# Altium schematic sheet MCU.SchDoc
size A4; SheetNumber: 2; SheetTotal: 8
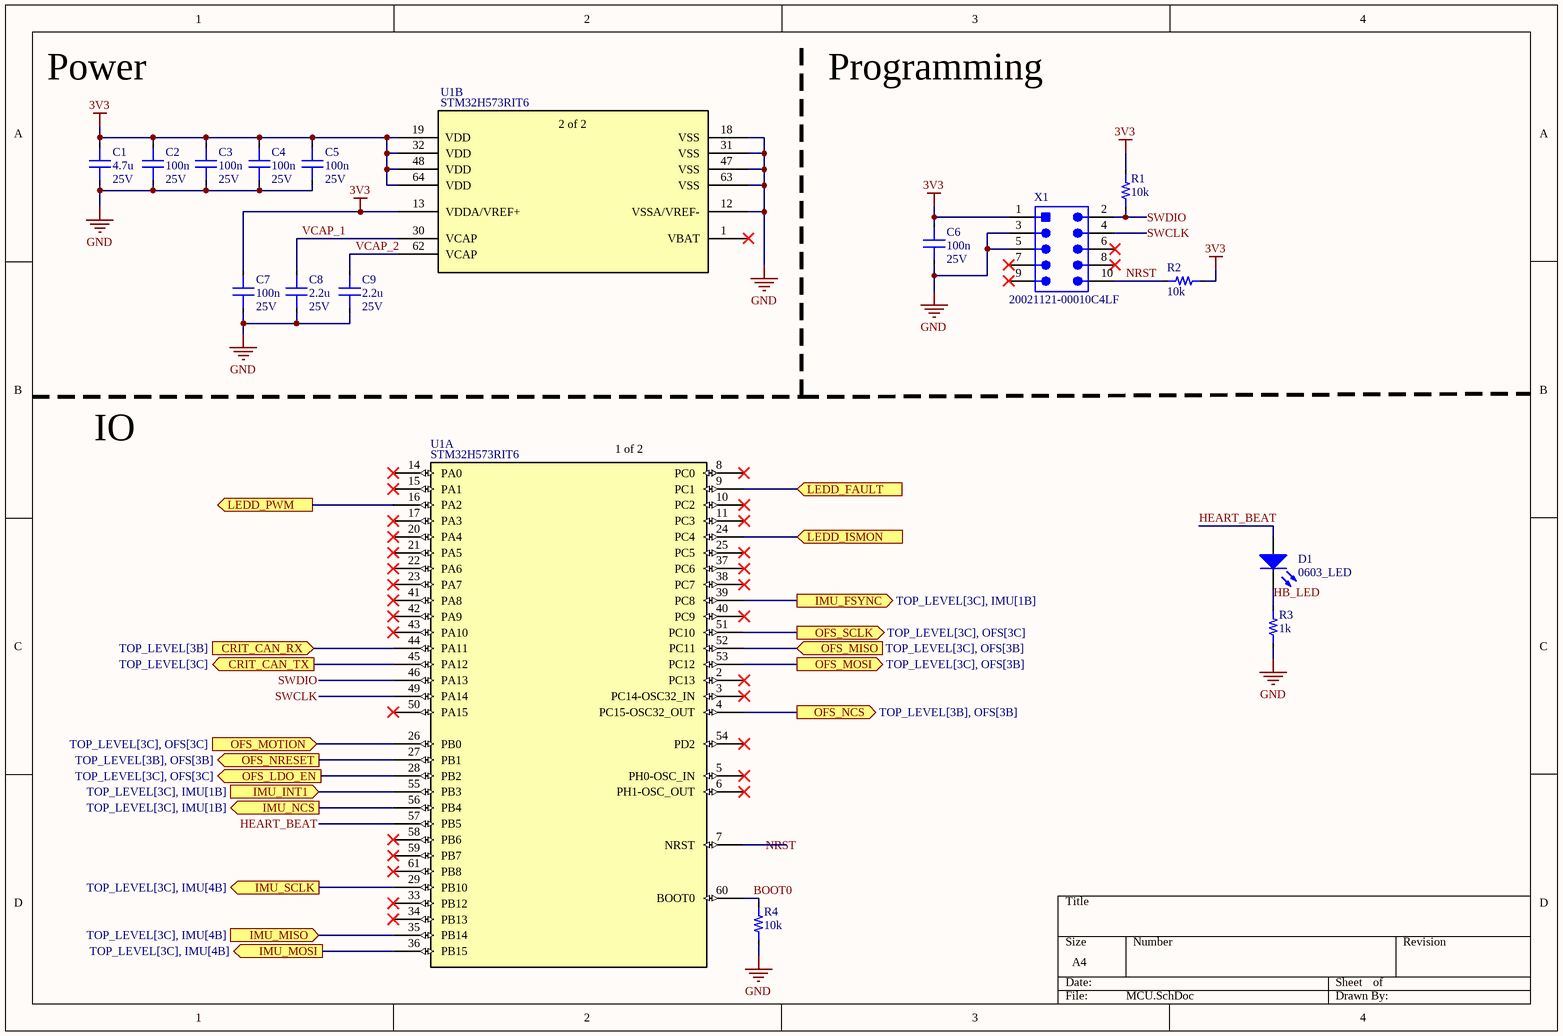
[diagram p0: MCU.SchDoc]

## Parts
C1  value 4.7u  Voltage: 25V  [0603_CAP]  (hidden comment: Capacitor)
C2  value 100n  Voltage: 25V  [0603_CAP]  (hidden comment: Capacitor)
C3  value 100n  Voltage: 25V  [0603_CAP]  (hidden comment: Capacitor)
C4  value 100n  Voltage: 25V  [0603_CAP]  (hidden comment: Capacitor)
C5  value 100n  Voltage: 25V  [0603_CAP]  (hidden comment: Capacitor)
C6  value 100n  Voltage: 25V  [0603_CAP]  (hidden comment: Capacitor)
C7  value 100n  Voltage: 25V  [0603_CAP]  (hidden comment: Capacitor)
C8  value 2.2u  Voltage: 25V  [0603_CAP]  (hidden comment: Capacitor)
C9  value 2.2u  Voltage: 25V  [0603_CAP]  (hidden comment: Capacitor)
D1  0603_LED  [0603_LED]
R1  value 10k  [0603_RES]  (hidden comment: Resistor)
R2  value 10k  [0603_RES]  (hidden comment: Resistor)
R3  value 1k  [0603_RES]  (hidden comment: Resistor)
R4  value 10k  [0603_RES]  (hidden comment: Resistor)
U1  STM32H573RIT6  [LQFP64-10x10mm_STM]  (parts A,B of 2)
X1  20021121-00010C4LF  [HDR2X5_SMT]

## Ports
CRIT_CAN_RX (in, see TOP_LEVEL[3B]), CRIT_CAN_TX (out, see TOP_LEVEL[3C]), IMU_FSYNC (out, see TOP_LEVEL[3C], IMU[1B]), IMU_INT1 (in, see TOP_LEVEL[3C], IMU[1B]), IMU_MISO (in, see TOP_LEVEL[3C], IMU[4B]), IMU_MOSI (out, see TOP_LEVEL[3C], IMU[4B]), IMU_NCS (out, see TOP_LEVEL[3C], IMU[1B]), IMU_SCLK (out, see TOP_LEVEL[3C], IMU[4B]), LEDD_FAULT (in), LEDD_ISMON (in), LEDD_PWM (out), OFS_LDO_EN (out, see TOP_LEVEL[3C], OFS[3C]), OFS_MISO (in, see TOP_LEVEL[3C], OFS[3B]), OFS_MOSI (out, see TOP_LEVEL[3C], OFS[3B]), OFS_MOTION (in, see TOP_LEVEL[3C], OFS[3C]), OFS_NCS (out, see TOP_LEVEL[3B], OFS[3B]), OFS_NRESET (out, see TOP_LEVEL[3B], OFS[3B]), OFS_SCLK (out, see TOP_LEVEL[3C], OFS[3C])

## Nets
3V3: C1.1 C2.1 C3.1 C4.1 C5.1 C6.1 C7.1 R1.1 R2.2 U1.13(VDDA/VREF+) U1.19(VDD) U1.32(VDD) U1.48(VDD) U1.64(VDD) X1.1
GND: C1.2 C2.2 C3.2 C4.2 C5.2 C6.2 C7.2 C8.2 C9.2 R3.1 R4.1 U1.12(VSSA/VREF-) U1.18(VSS) U1.31(VSS) U1.47(VSS) U1.63(VSS) X1.3 X1.5
BOOT0: R4.2 U1.60(BOOT0)
CRIT_CAN_RX: U1.44(PA11) ; port CRIT_CAN_RX
CRIT_CAN_TX: U1.45(PA12) ; port CRIT_CAN_TX
HB_LED: D1.1(C) R3.2
HEART_BEAT: D1.2(A) U1.57(PB5)
IMU_FSYNC: U1.39(PC8) ; port IMU_FSYNC
IMU_INT1: U1.55(PB3) ; port IMU_INT1
IMU_MISO: U1.35(PB14) ; port IMU_MISO
IMU_MOSI: U1.36(PB15) ; port IMU_MOSI
IMU_NCS: U1.56(PB4) ; port IMU_NCS
IMU_SCLK: U1.29(PB10) ; port IMU_SCLK
LEDD_FAULT: U1.9(PC1) ; port LEDD_FAULT
LEDD_ISMON: U1.24(PC4) ; port LEDD_ISMON
LEDD_PWM: U1.16(PA2) ; port LEDD_PWM
NRST: R2.1 U1.7(NRST) X1.10
OFS_LDO_EN: U1.28(PB2) ; port OFS_LDO_EN
OFS_MISO: U1.52(PC11) ; port OFS_MISO
OFS_MOSI: U1.53(PC12) ; port OFS_MOSI
OFS_MOTION: U1.26(PB0) ; port OFS_MOTION
OFS_NCS: U1.4(PC15-OSC32_OUT) ; port OFS_NCS
OFS_NRESET: U1.27(PB1) ; port OFS_NRESET
OFS_SCLK: U1.51(PC10) ; port OFS_SCLK
SWCLK: U1.49(PA14) X1.4
SWDIO: R1.2 U1.46(PA13) X1.2
VCAP_1: C8.1 U1.30(VCAP)
VCAP_2: C9.1 U1.62(VCAP)

Not connected (* = marked no-connect by the designer): U1 1(VBAT)* 2(PC13)* 3(PC14-OSC32_IN)* 5(PH0-OSC_IN)* 6(PH1-OSC_OUT)* 8(PC0)* 10(PC2)* 11(PC3)* 14(PA0)* 15(PA1)* 17(PA3)* 20(PA4)* 21(PA5)* 22(PA6)* 23(PA7)* 25(PC5)* 33(PB12)* 34(PB13)* 37(PC6)* 38(PC7)* 40(PC9)* 41(PA8)* 42(PA9)* 43(PA10)* 50(PA15)* 54(PD2)* 58(PB6)* 59(PB7)* 61(PB8)*; X1 6* 7* 8* 9*

## Notes on the sheet
- Power
- Programming
- IO
- (in symbol STM32H573RIT6, part A) 1 of 2
- (in symbol STM32H573RIT6, part B) 2 of 2

## Library data of the parts
D1 = 0603_LED: WL-SMCW Mono-color Chip LED Waterclear, SMT, size 0603, Blue, 3.2V, 140°; Manufacturer Part Number: 150060BS75000; Manufacturer: Wurth Elektronik; Case/Size Code: 0603; Chip Technology: InGaN; Dominant Wavelength: 470nm; Luminous Intensity: 145mcd; Peak Wavelength: 465nm; Category: Signal LEDs; Match Code: WL-SMCW; ComponentLink1Description: Website Link; ComponentLink1URL: https://www.we-online.com/redexpert/article/150060BS75000?ad; ComponentLink2Description: Datasheet Link; ComponentLink2URL: https://www.we-online.com/redexpert/spec/150060BS75000?ad; Mount: Surface Mount; Operating Temperature Max: 85°C; Operating Temperature Min: -40°C; Packaging: Tape and Reel; Length: 1.6mm; Width: 0.8mm; Height: 0.7mm; Emitting Color: Blue; Forward Voltage: 3.2V; Viewing Angle: 140°
U1 = STM32H573RIT6: Mfr_Name: STMicroelectronics; RefDes: RefDes; Type: Type
X1 = 20021121-00010C4LF: Header, 10-Leads, Body 3.43x6.35mm, Pitch 1.27mm; Circuits: 10; Name: 20021121-00010C4LF; ComponentLink1Description: Digikey; ComponentLink1URL: https://www.digikey.com/product-detail/en/amphenol-icc-fci/20021121-00010C4LF/609-3695-1-ND/2209147
C1-C9 = Capacitor: Dielectric: *; Percent Tolerance: *; ESR: *
R1-R4 = Resistor: Tolerance: *